# Altium schematic sheet PA.SchDoc
size A; SheetNumber: 7; SheetTotal: 8
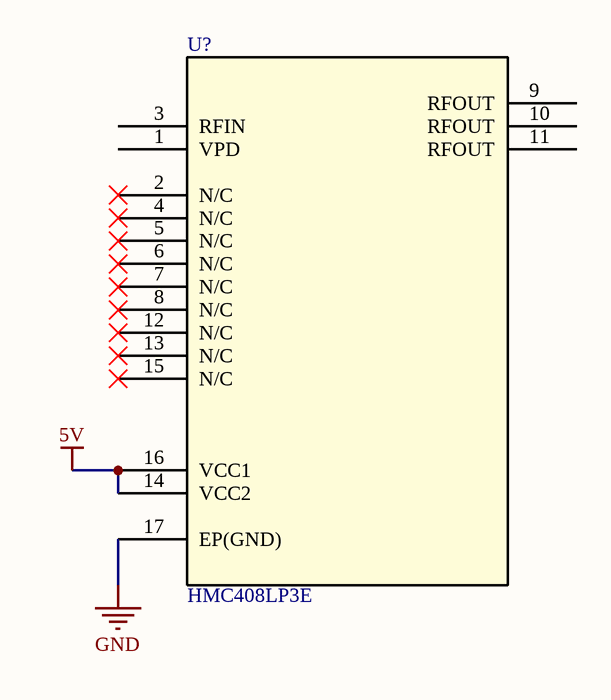
[diagram p0: PA.SchDoc]

## Parts
U?  HMC408LP3E  [HCP_16_1_ADI]

## Nets
5V: U?.14(VCC2) U?.16(VCC1)
GND: U?.17(EP(GND))

Not connected (* = marked no-connect by the designer): U? 1(VPD) 2(N/C)* 3(RFIN) 4(N/C)* 5(N/C)* 6(N/C)* 7(N/C)* 8(N/C)* 9(RFOUT) 10(RFOUT) 11(RFOUT) 12(N/C)* 13(N/C)* 15(N/C)*

## Library data of the parts
U? = HMC408LP3E_1: 1 Watt Power Amplifier SMT, 5.1 - 5.9 GHz; Manufacturer_Name: Analog Devices Inc; Copyright: Copyright (C) 2026 Ultra Librarian. All rights reserved.; Manufacturer_Part_Number: HMC408LP3E; Datasheet: https://www.analog.com/media/en/technical-documentation/data-sheets/hmc408.pdf; RefDes: RefDes; Type: Type